# Altium project Buttons-Board-v1.0.PrjPcb
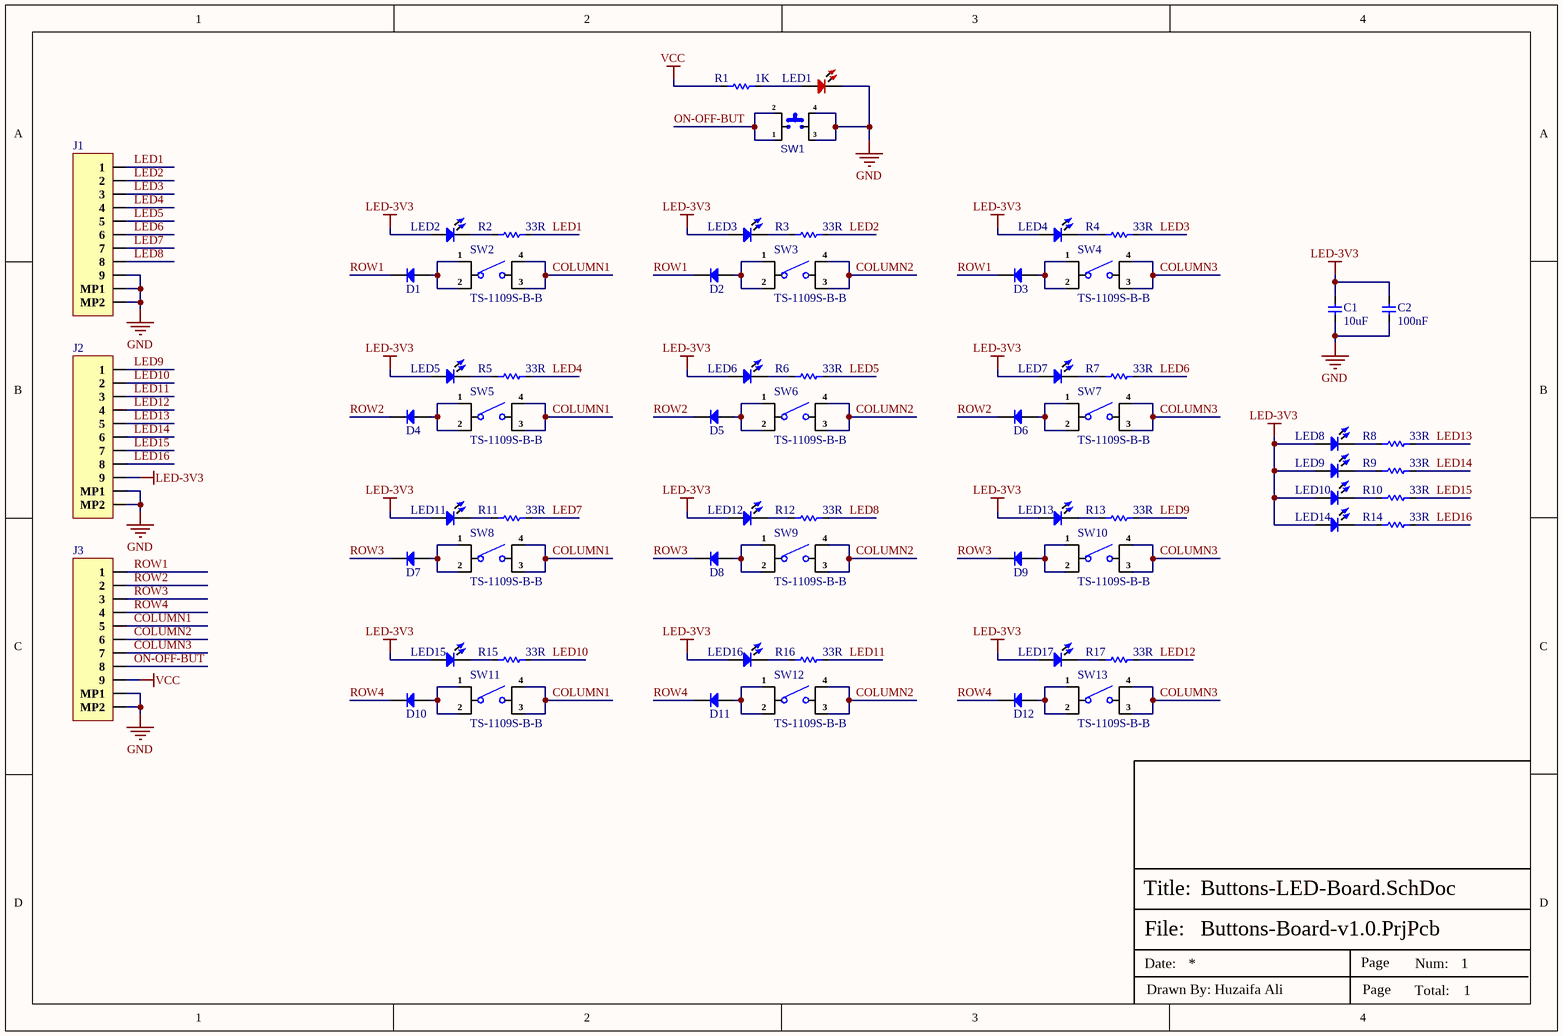
[diagram p0: Buttons-LED-Board.SchDoc]
1 sheet, 64 parts. Net scope: global (net labels, ports and power ports of the same name join across sheets).

## Sheet Buttons-LED-Board.SchDoc
size A4; SheetNumber: 1; SheetTotal: 1

### Parts
C1  10uF  [Cap-0603]
C2  100nF  [Cap-0402]
D1  1N4148WS-7-F  [SOD-323]  (value not drawn)
D2  1N4148WS-7-F  [SOD-323]  (value not drawn)
D3  1N4148WS-7-F  [SOD-323]  (value not drawn)
D4  1N4148WS-7-F  [SOD-323]  (value not drawn)
D5  1N4148WS-7-F  [SOD-323]  (value not drawn)
D6  1N4148WS-7-F  [SOD-323]  (value not drawn)
D7  1N4148WS-7-F  [SOD-323]  (value not drawn)
D8  1N4148WS-7-F  [SOD-323]  (value not drawn)
D9  1N4148WS-7-F  [SOD-323]  (value not drawn)
D10  1N4148WS-7-F  [SOD-323]  (value not drawn)
D11  1N4148WS-7-F  [SOD-323]  (value not drawn)
D12  1N4148WS-7-F  [SOD-323]  (value not drawn)
J1  X1002WRS-09E-LPSWHF  [X1002WRS-09E-LPSWHF]  (value not drawn)
J2  X1002WRS-09E-LPSWHF  [X1002WRS-09E-LPSWHF]  (value not drawn)
J3  X1002WRS-09E-LPSWHF  [X1002WRS-09E-LPSWHF]  (value not drawn)
LED1  RED  [LED-0603]  (value not drawn)
LED2  Blue  [LED-0603]  (value not drawn)
LED3  Blue  [LED-0603]  (value not drawn)
LED4  Blue  [LED-0603]  (value not drawn)
LED5  Blue  [LED-0603]  (value not drawn)
LED6  Blue  [LED-0603]  (value not drawn)
LED7  Blue  [LED-0603]  (value not drawn)
LED8  Blue  [LED-0603]  (value not drawn)
LED9  Blue  [LED-0603]  (value not drawn)
LED10  Blue  [LED-0603]  (value not drawn)
LED11  Blue  [LED-0603]  (value not drawn)
LED12  Blue  [LED-0603]  (value not drawn)
LED13  Blue  [LED-0603]  (value not drawn)
LED14  Blue  [LED-0603]  (value not drawn)
LED15  Blue  [LED-0603]  (value not drawn)
LED16  Blue  [LED-0603]  (value not drawn)
LED17  Blue  [LED-0603]  (value not drawn)
R1  1K  [Res-0402]
R2  33R  [Res-0201]
R3  33R  [Res-0201]
R4  33R  [Res-0201]
R5  33R  [Res-0201]
R6  33R  [Res-0201]
R7  33R  [Res-0201]
R8  33R  [Res-0201]
R9  33R  [Res-0201]
R10  33R  [Res-0201]
R11  33R  [Res-0201]
R12  33R  [Res-0201]
R13  33R  [Res-0201]
R14  33R  [Res-0201]
R15  33R  [Res-0201]
R16  33R  [Res-0201]
R17  33R  [Res-0201]
SW1  TL3300CF160Q  [TL3300CF160Q.]  (value not drawn)
SW2  TS-1109S-B-B  [TS-1109S-B-B]
SW3  TS-1109S-B-B  [TS-1109S-B-B]
SW4  TS-1109S-B-B  [TS-1109S-B-B]
SW5  TS-1109S-B-B  [TS-1109S-B-B]
SW6  TS-1109S-B-B  [TS-1109S-B-B]
SW7  TS-1109S-B-B  [TS-1109S-B-B]
SW8  TS-1109S-B-B  [TS-1109S-B-B]
SW9  TS-1109S-B-B  [TS-1109S-B-B]
SW10  TS-1109S-B-B  [TS-1109S-B-B]
SW11  TS-1109S-B-B  [TS-1109S-B-B]
SW12  TS-1109S-B-B  [TS-1109S-B-B]
SW13  TS-1109S-B-B  [TS-1109S-B-B]

### Nets
GND: C1.1 C2.1 J1.9 J1.MP1 J1.MP2 J2.MP1 J2.MP2 J3.MP1 J3.MP2 LED1.2 SW1.3 SW1.4
LED-3V3: C1.2 C2.2 J2.9 LED2.1 LED3.1 LED4.1 LED5.1 LED6.1 LED7.1 LED8.1 LED9.1 LED10.1 LED11.1 LED12.1 LED13.1 LED14.1 LED15.1 LED16.1 LED17.1
VCC: J3.9 R1.2
COLUMN1: J3.5 SW2.3 SW2.4 SW5.3 SW5.4 SW8.3 SW8.4 SW11.3 SW11.4
COLUMN2: J3.6 SW3.3 SW3.4 SW6.3 SW6.4 SW9.3 SW9.4 SW12.3 SW12.4
COLUMN3: J3.7 SW4.3 SW4.4 SW7.3 SW7.4 SW10.3 SW10.4 SW13.3 SW13.4
LED1: J1.1 R2.2
LED2: J1.2 R3.2
LED3: J1.3 R4.2
LED4: J1.4 R5.2
LED5: J1.5 R6.2
LED6: J1.6 R7.2
LED7: J1.7 R11.2
LED8: J1.8 R12.2
LED9: J2.1 R13.2
LED10: J2.2 R15.2
LED11: J2.3 R16.2
LED12: J2.4 R17.2
LED13: J2.5 R8.2
LED14: J2.6 R9.2
LED15: J2.7 R10.2
LED16: J2.8 R14.2
ON-OFF-BUT: J3.8 SW1.1 SW1.2
ROW1: D1.1(K) D2.1(K) D3.1(K) J3.1
ROW2: D4.1(K) D5.1(K) D6.1(K) J3.2
ROW3: D7.1(K) D8.1(K) D9.1(K) J3.3
ROW4: D10.1(K) D11.1(K) D12.1(K) J3.4
NetD1_2: D1.2(A) SW2.1 SW2.2
NetD2_2: D2.2(A) SW3.1 SW3.2
NetD3_2: D3.2(A) SW4.1 SW4.2
NetD4_2: D4.2(A) SW5.1 SW5.2
NetD5_2: D5.2(A) SW6.1 SW6.2
NetD6_2: D6.2(A) SW7.1 SW7.2
NetD7_2: D7.2(A) SW8.1 SW8.2
NetD8_2: D8.2(A) SW9.1 SW9.2
NetD9_2: D9.2(A) SW10.1 SW10.2
NetD10_2: D10.2(A) SW11.1 SW11.2
NetD11_2: D11.2(A) SW12.1 SW12.2
NetD12_2: D12.2(A) SW13.1 SW13.2
NetLED1_1: LED1.1 R1.1
NetLED2_2: LED2.2 R2.1
NetLED3_2: LED3.2 R3.1
NetLED4_2: LED4.2 R4.1
NetLED5_2: LED5.2 R5.1
NetLED6_2: LED6.2 R6.1
NetLED7_2: LED7.2 R7.1
NetLED8_2: LED8.2 R8.1
NetLED9_2: LED9.2 R9.1
NetLED10_2: LED10.2 R10.1
NetLED11_2: LED11.2 R11.1
NetLED12_2: LED12.2 R12.1
NetLED13_2: LED13.2 R13.1
NetLED14_2: LED14.2 R14.1
NetLED15_2: LED15.2 R15.1
NetLED16_2: LED16.2 R16.1
NetLED17_2: LED17.2 R17.1

### Notes on the sheet
- File:
- Title:
- Date:
- Page
- Num:
- Total:
- Drawn By: Huzaifa Ali

### Library data of the parts
C1 = CC0603KRX5R7BB106: CAP CER 10UF 16V X5R 0603; Manufacturer: Yageo; Tolerance: 10%; Item Type: Capacitor; Supplier 1: Digi-Key; Manufacturer Part Number: CC0603KRX5R7BB106; RoHS: Yes; Category: Ceramic Capacitors; Stock 1: 240725; Pricing 1: 1=0.68000, 10=0.48000, 50=0.36300, 100=0.31610, 500=0.23416, 1000=0.19903 (USD); Mount: Surface Mount; Case/Package: 0603; Case Code (Imperial): 0603; Case Code (Metric): 1608; Min Operating Temperature: -55°C; Max Operating Temperature: 85°C; Packaging: Cut Tape; Capacitance: 10uF; Voltage Rating: 16V; RoHS Compliant: Yes; ComponentLink1URL: http://www.yageo.com/documents/recent/UPY-GPHC_X5R_4V-to-50V_25.pdf?src-supplier=Digi-Key; ComponentLink1Description: http://www.yageo.com/documents/recent/UPY-GPHC_X5R_4V-to-50V_25.pdf?src-supplier=Digi-Key; Supplier Part Number 1: 311-3486-1-ND; LCSC Part Number: C2936601
C2 = CC0402KRX5R7BB104: CAP CER 0.1UF 16V X5R 0402; Manufacturer: Yageo; Tolerance: 10%; Supplier 1: Mouser; Manufacturer Part Number: CC0402KRX5R7BB104; RoHS: Yes; Category: Ceramic Capacitors; Stock 1: 936792; Pricing 1: 1=0.10000, 10=0.02300, 50=0.02300, 100=0.01100, 1000=0.00600, 10000=0.00400 (USD); Mount: Surface Mount; Case/Package: 0402; Number of Pins: 2; Case Code (Metric): 1005; Case Code (Imperial): 0402; Min Operating Temperature: -55°C; Max Operating Temperature: 85°C; Capacitance: 100nF; Dielectric: X5R; Packaging: Tape and Reel; Voltage Rating: 16V; Package Quantity: 1; Voltage Rating (DC): 16V; Termination: SMD/SMT; Resistor Type: Ceramic; Series: CC; Construction: Flat; Length: 1mm; Width: 0.02inch; Height: 0.5mm; Thickness: 0.022inch; Depth: 0.5mm; Radiation Hardening: No; REACH SVHC: Unknown; Lead Free: Lead Free; Halogen Free: Halogen Free; RoHS Compliant: Yes; ComponentLink1URL: https://datasheet.ciiva.com/155/mlccorderingcode-155879.pdf?src-supplier=Digi-Key; ComponentLink1Description: https://datasheet.ciiva.com/155/mlccorderingcode-155879.pdf?src-supplier=Digi-Key; ComponentLink2URL: https://datasheet.ciiva.com/155/mlccorderingcode-155878.pdf?src-supplier=Digi-Key; ComponentLink2Description: https://datasheet.ciiva.com/155/mlccorderingcode-155878.pdf?src-supplier=Digi-Key; ComponentLink3URL: https://datasheet.ciiva.com/155/mlccorderingcode-155880.pdf?src-supplier=Digi-Key; ComponentLink3Description: https://datasheet.ciiva.com/155/mlccorderingcode-155880.pdf?src-supplier=Digi-Key; ComponentLink4URL: https://datasheet.ciiva.com/11464/upy-gphc-x5r-4v-to-50v-12-11464869.pdf?src-supplier=Avnet; ComponentLink4Description: https://datasheet.ciiva.com/11464/upy-gphc-x5r-4v-to-50v-12-11464869.pdf?src-supplier=Avnet; Supplier Part Number 1: 603-CC402KRX5R7BB104; LCSC Part Number: C106204
D1-D12 = 1N4148WS-7-F: DIODE GEN PURP 75V 150MA SOD323; Manufacturer: Diodes; Forward Current: 300mA; Reverse Recovery Time: 4ns; Element Configuration: Single; Forward Voltage: 1.25V; Max Reverse Current: 1uA; Peak Non-Repetitive Surge Current: 2A; Power Dissipation: 200mW; Polarity: Standard; Capacitance: 2pF; Supplier 1: Mouser; Manufacturer Part Number: 1N4148WS-7-F; RoHS: Yes; Category: Rectifier Diodes; Pricing 1: 1=0.19000, 10=0.17500, 50=0.17500, 100=0.09600, 500=0.05900, 1000=0.04000, 3000=0.03000, 9000=0.02600, 10000=0.02600, 24000=0.02300, 45000=0.01900 (USD); Mount: Surface Mount; Number of Pins: 2; Weight: 0.000173oz; Contact Plating: Tin,Matte; Min Operating Temperature: -65°C; Max Operating Temperature: 150°C; Max Repetitive Reverse Voltage (Vrrm): 75V; Max Forward Surge Current (Ifsm): 2A; Max Surge Current: 2A; Packaging: Tape and Reel; Recovery Time: 4ns; Package Quantity: 3000; Average Rectified Current: 150mA; Voltage Rating (DC): 75V; Power Rating: 200mW; Current Rating: 150mA; Output Current: 150mA; Voltage: 75V; Max Reverse Voltage (DC): 75V; Series: -; Reverse Recovery Time-Max: 4ns; Length: 1.8mm; Width: 1.4mm; Height: 1mm; Radiation Hardening: No; REACH SVHC: No SVHC; Lead Free: Lead Free; RoHS Compliant: Yes; ComponentLink1URL: https://datasheet.ciiva.com/1179/ds30097-1179355.pdf?src-supplier=Element14; ComponentLink1Description: https://datasheet.ciiva.com/1179/ds30097-1179355.pdf?src-supplier=Element14; ComponentLink2URL: https://datasheet.ciiva.com/8300/ds30097-8300396.pdf?src-supplier=Avnet; ComponentLink2Description: https://datasheet.ciiva.com/8300/ds30097-8300396.pdf?src-supplier=Avnet; ComponentLink3URL: https://datasheet.ciiva.com/16199/ds30097-16199061.pdf?src-supplier=Future+Electronics; ComponentLink3Description: https://datasheet.ciiva.com/16199/ds30097-16199061.pdf?src-supplier=Future+Electronics; ComponentLink4URL: https://datasheet.ciiva.com/911/ds30097-911742.pdf?src-supplier=Digi-Key; ComponentLink4Description: https://datasheet.ciiva.com/911/ds30097-911742.pdf?src-supplier=Digi-Key; ComponentLink5URL: https://datasheet.ciiva.com/911/ds30097-911743.pdf?src-supplier=Digi-Key; ComponentLink5Description: https://datasheet.ciiva.com/911/ds30097-911743.pdf?src-supplier=Digi-Key; ComponentLink6URL: https://datasheet.ciiva.com/911/ds30097-911741.pdf?src-supplier=Digi-Key; ComponentLink6Description: https://datasheet.ciiva.com/911/ds30097-911741.pdf?src-supplier=Digi-Key; Supplier Part Number 1: 621-1N4148WS-F; LCSC Part Number: C60580; Item Type: Diode
J1-J3 = X1002WRS-09E-LPSWHF: 1x9P 1 Tin 1mm male 9 260℃ -25℃~+85℃ Brass 1A Surface Mount SMD,P=1mm Wire To Board / Wire To Wire Connector ROHS; Manufacturer: XKB Connectivity; Manufacturer Part Number: X1002WRS-09E-LPSWHF; Package: SMD,P=1mm; LCSC Part Number: C437069; Item Type: Board / Wire To Wire Connector; ComponentLink1Description: LCSC; ComponentLink1URL: https://www.lcsc.com/product-detail/Wire-To-Board-Wire-To-Wire-Connector_XKB-Connectivity-X1002WRS-09E-LPSWHF_C437069.html
LED1 = NCD0603R3: RED LED 0603 Light Emitting Diodes; Manufacturer: Foshan NationStar Optoelectronics; Manufacturer Part Number: NCD0603R3; Package: 0603; Item Type: LED; LCSC Part Number: C3151730; ComponentLink1Description: LCSC; ComponentLink1URL: https://www.lcsc.com/product-detail/Light-Emitting-Diodes-LED_Foshan-NationStar-Optoelectronics-NCD0603R3_C3151730.html
LED2-LED17 = NCD0603B3: blue 0603 Light Emitting Diodes (LED) ROHS; Manufacturer: Foshan NationStar Optoelectronics; Manufacturer Part Number: NCD0603B3; Package: 0603; LCSC Part Number: C158101; Item Type: LED; ComponentLink1Description: LCSC; ComponentLink1URL: https://www.lcsc.com/product-detail/Light-Emitting-Diodes-LED_Foshan-NationStar-Optoelectronics-NCD0603B3_C158101.html
R1 = RC0402FR-071KL: RES 1K OHM 1% 1/16W 0402; Manufacturer: Yageo; Resistance: 1kR; Temperature Coefficient: 100ppm/°C; Voltage Rating (DC): 50V; Power Rating: 62.5mW; Max Power Dissipation: 63mW; Item Type: Resistor; Supplier 1: Avnet; Manufacturer Part Number: RC0402FR-071KL; RoHS: Yes; Category: Chip SMD Resistors; Stock 1: 13030000; Pricing 1: 10000=0.00085, 20000=0.00087, 40000=0.00084, 60000=0.00083, 80000=0.00079, 100000=0.00078, 1000000=0.00076 (USD); Case/Package: 0402; Number of Pins: 2; Case Code (Imperial): 0402; Case Code (Metric): 1005; Size Code: 0402; Min Operating Temperature: -55°C; Max Operating Temperature: 155°C; Resistor Type: Thick Film; Tolerance: 1%; Packaging: Tape and Reel; Voltage Rating: 50V; Termination: SMD/SMT; Features: Moisture Resistant; Series: RC; Number of Terminations: 2; Resistance Tolerance: 1%; Construction: Rectangular; Technology: THICK FILM; Length: 1mm; Width: 0.5mm; Height: 0.32mm; Depth: 0.5mm; Reach SVHC Compliant: Yes; Lead Free: Lead Free; RoHS Compliant: Yes; Military Standard: Not; ComponentLink1URL: https://datasheet.ciiva.com/11819/0900766b80c66297-11819477.pdf?src-supplier=RSComponents; ComponentLink1Description: https://datasheet.ciiva.com/11819/0900766b80c66297-11819477.pdf?src-supplier=RSComponents; ComponentLink2URL: https://datasheet.ciiva.com/7983/1018594-7983502.pdf?src-supplier=Element14; ComponentLink2Description: https://datasheet.ciiva.com/7983/1018594-7983502.pdf?src-supplier=Element14; ComponentLink3URL: https://datasheet.ciiva.com/22747/1018594-22747513.pdf?src-supplier=Element14; ComponentLink3Description: https://datasheet.ciiva.com/22747/1018594-22747513.pdf?src-supplier=Element14; ComponentLink4URL: https://datasheet.ciiva.com/12666/pyu-rc0402-51-rohs-l-6-r-12666741.pdf?src-supplier=Mouser; ComponentLink4Description: https://datasheet.ciiva.com/12666/pyu-rc0402-51-rohs-l-6-r-12666741.pdf?src-supplier=Mouser; ComponentLink5URL: https://datasheet.ciiva.com/7849/1018594-7849869.pdf?src-supplier=Element14; ComponentLink5Description: https://datasheet.ciiva.com/7849/1018594-7849869.pdf?src-supplier=Element14; ComponentLink6URL: https://datasheet.ciiva.com/7849/1018594-7849871.pdf?src-supplier=Element14; ComponentLink6Description: https://datasheet.ciiva.com/7849/1018594-7849871.pdf?src-supplier=Element14; ComponentLink7URL: https://datasheet.ciiva.com/17063/pyu-rc0402-51-rohs-l-6-r-17063193.pdf?src-supplier=Future+Electronics; ComponentLink7Description: https://datasheet.ciiva.com/17063/pyu-rc0402-51-rohs-l-6-r-17063193.pdf?src-supplier=Future+Electronics; Supplier Part Number 1: RC0402FR-071KL; LCSC Part Number: C106235
R2-R17 = RC0201FR-0733RL: RES 33 OHM 1% 1/20W 0201; Manufacturer: Yageo; Item Type: Resistor; Supplier: Future Electronics; Supplier Part Number: 6199285; Manufacturer Part Number: RC0201FR-0733RL; RoHS: Yes; Category: Chip SMD Resistors; Stock: 1420000; Pricing: 10000=0.0013, 50000=0.0012, 250000=0.0012, 750000=0.0011, 2000000=0.001 (USD); ComponentLink1URL: https://datasheet.ciiva.com/2560/pyu-r-int-thick-7-2560877.pdf?src-supplier=Digi-Key; ComponentLink1Description: https://datasheet.ciiva.com/2560/pyu-r-int-thick-7-2560877.pdf?src-supplier=Digi-Key; ComponentLink2URL: https://datasheet.ciiva.com/2560/pyu-r-int-thick-7-2560878.pdf?src-supplier=Digi-Key; ComponentLink2Description: https://datasheet.ciiva.com/2560/pyu-r-int-thick-7-2560878.pdf?src-supplier=Digi-Key; ComponentLink3URL: https://datasheet.ciiva.com/2560/pyu-r-int-thick-7-2560879.pdf?src-supplier=Digi-Key; ComponentLink3Description: https://datasheet.ciiva.com/2560/pyu-r-int-thick-7-2560879.pdf?src-supplier=Digi-Key; ComponentLink4URL: https://datasheet.ciiva.com/7672/1563626-7672223.pdf?src-supplier=Element14; ComponentLink4Description: https://datasheet.ciiva.com/7672/1563626-7672223.pdf?src-supplier=Element14; ComponentLink5URL: https://datasheet.ciiva.com/22698/1563626-22698520.pdf?src-supplier=Element14; ComponentLink5Description: https://datasheet.ciiva.com/22698/1563626-22698520.pdf?src-supplier=Element14; LCSC Part Number: C295794
SW1 = TL3300CF160Q: SWITCH TACTILE SPST-NO 0.05A 12V; Manufacturer: E-Switch; Mechanical Life: 200000Cycles; Operating Force: 160gf; Current Rating: 50mA; Throw Configuration: SPST; Contact Resistance: 100mR; Illumination Type: Non-Illuminated; Switch Travel: 0.35mm; Switch Function: Off-Mom; Actuator Type: Standard; Actuator Length: 5mm; Item Type: Tactile Switch; Supplier 1: Mouser; Manufacturer Part Number: TL3300CF160Q; Stock 1: 1884; Pricing 1: 1=0.53, 10=0.513, 50=0.43, 100=0.393, 1000=0.293, 10000=0.274 (USD); Mount: Surface Mount; Case/Package: SMD/SMT; Contact Plating: Silver; Min Operating Temperature: -25°C; Max Operating Temperature: 70°C; Package Quantity: 1; Packaging: Tape and Reel; Voltage Rating (DC): 12V; Max Voltage Rating (DC): 12V; Termination: Gull Wing; Electrical Life: 200000Cycles; Orientation: Straight; Series: TL3300; Lead Free: Lead Free; RoHS Compliant: Yes; ComponentLink1URL: http://www.e-switch.com/system/asset/product_line/data_sheet/157/TL3300.pdf?src-supplier=Digi-Key; ComponentLink1Description: http://www.e-switch.com/system/asset/product_line/data_sheet/157/TL3300.pdf?src-supplier=Digi-Key; ComponentLink2URL: http://spec_sheets.e-switch.com/specs/N301102.pdf?src-supplier=Digi-Key; ComponentLink2Description: http://spec_sheets.e-switch.com/specs/N301102.pdf?src-supplier=Digi-Key; Supplier Part Number 1: 612-TL3300CF160Q; LCSC Part Number: C273516
SW2-SW13 = TS-1109S-B-B: No NO 50mA 100000 Times 160gf 12V Brick nogging SPST SMD Tactile Switches ROHS; Manufacturer: XKB Connectivity; Manufacturer Part Number: TS-1109S-B-B; Package: SMD; LCSC Part Number: C480315; Item Type: Tactile Switch; ComponentLink1Description: LCSC; ComponentLink1URL: https://www.lcsc.com/product-detail/Tactile-Switches_XKB-Connectivity-TS-1109S-B-B_C480315.html